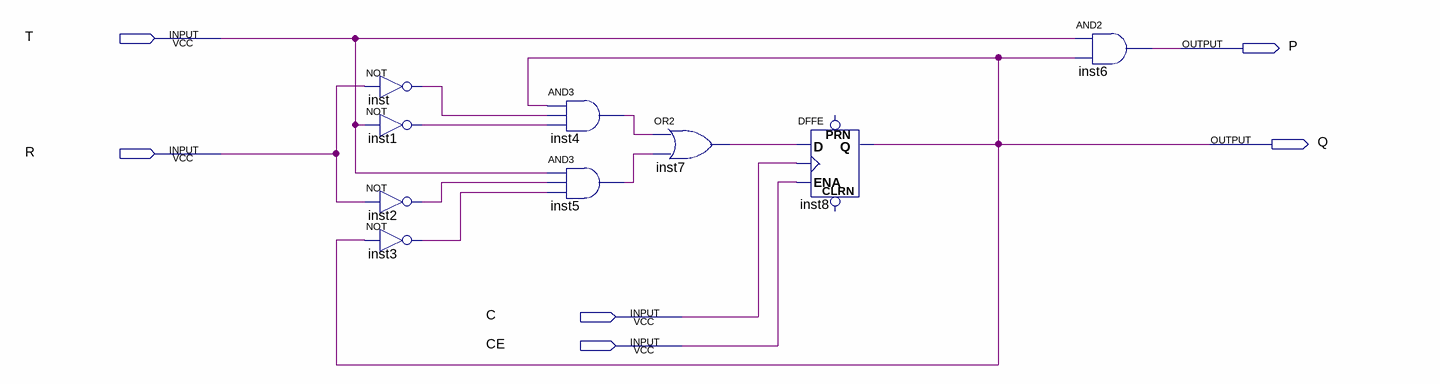
[diagram p0: schematic sheet]
// Quartus schematic ReceivCTEB.bdf as structural Verilog: 9 symbols, 6 pins
module ReceivCTEB (
  input  T,
  input  R,
  input  C,
  input  CE,
  output P,
  output Q
);

  wire inst1_out, inst2_out, inst3_out, inst4_out, inst5_out, inst7_out, inst_out;

  not inst (inst_out, R);
  not inst1 (inst1_out, T);
  not inst2 (inst2_out, R);
  not inst3 (inst3_out, Q);
  and inst4 (inst4_out, Q, inst_out, inst1_out);
  and inst5 (inst5_out, T, inst2_out, inst3_out);
  or inst7 (inst7_out, inst4_out, inst5_out);
  DFFE inst8 (.D(inst7_out), .CLK(C), .ENA(CE), .Q(Q));  // open: PRN, CLRN
  and inst6 (P, T, Q);
endmodule
